# EAGLE schematic esp32 nfc (EAGLE 9.7.0)
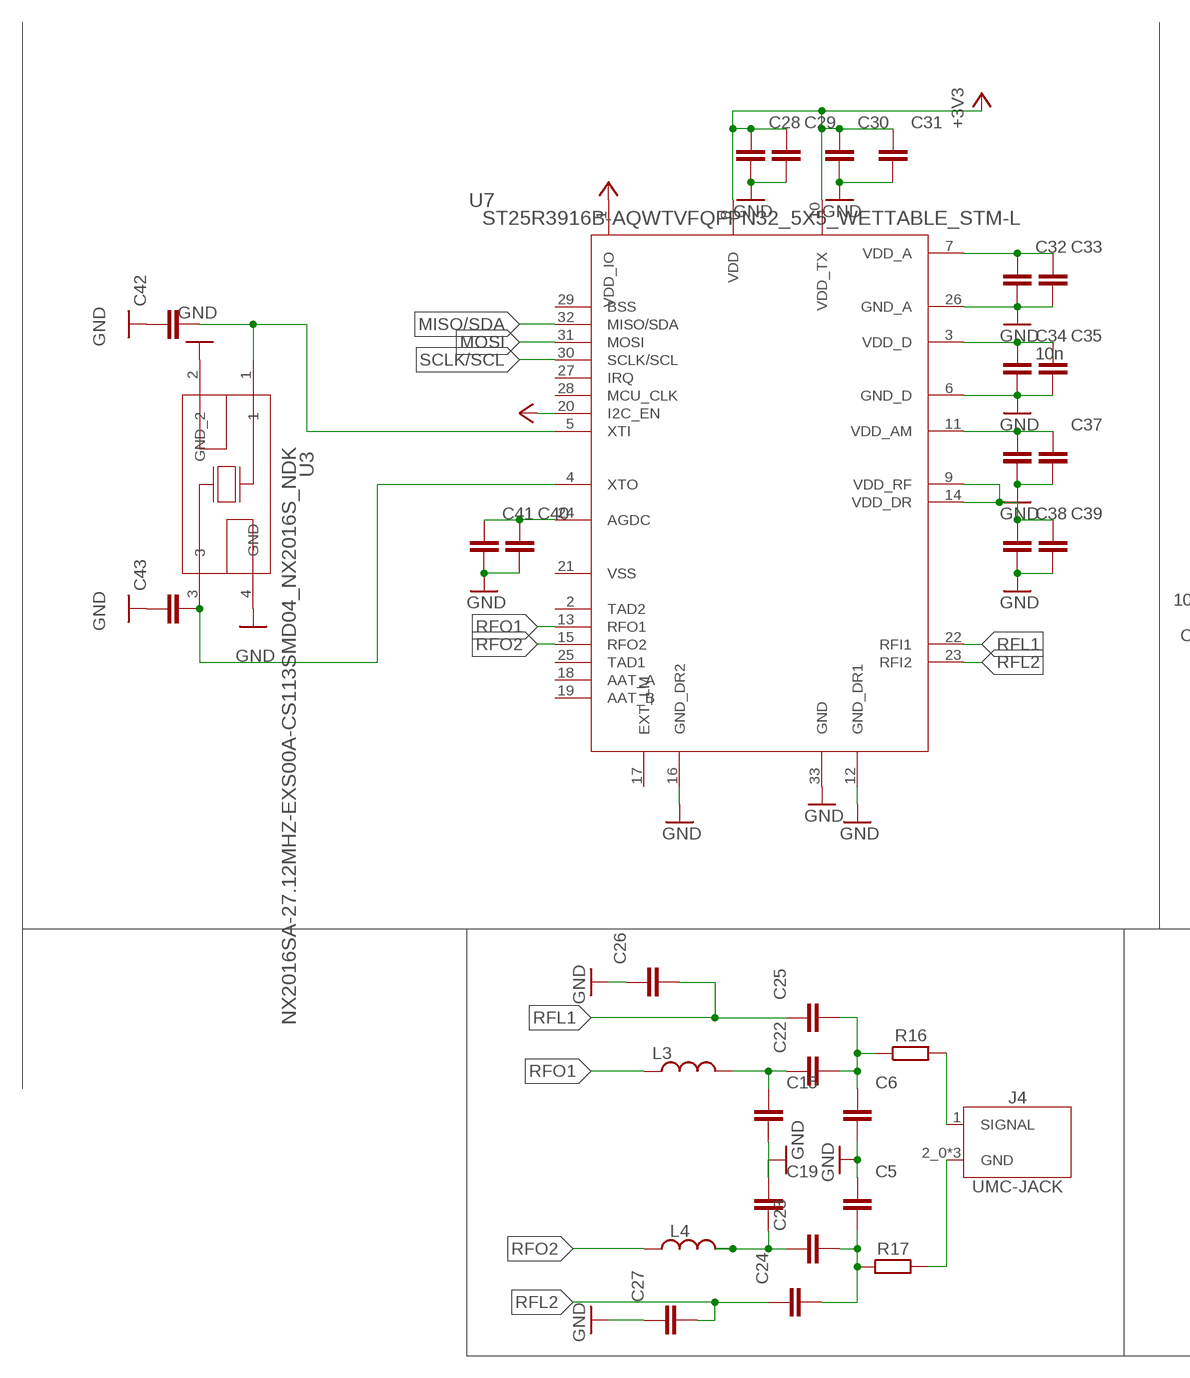
[diagram p0: schematic, sheet 1, part 1 of 2]
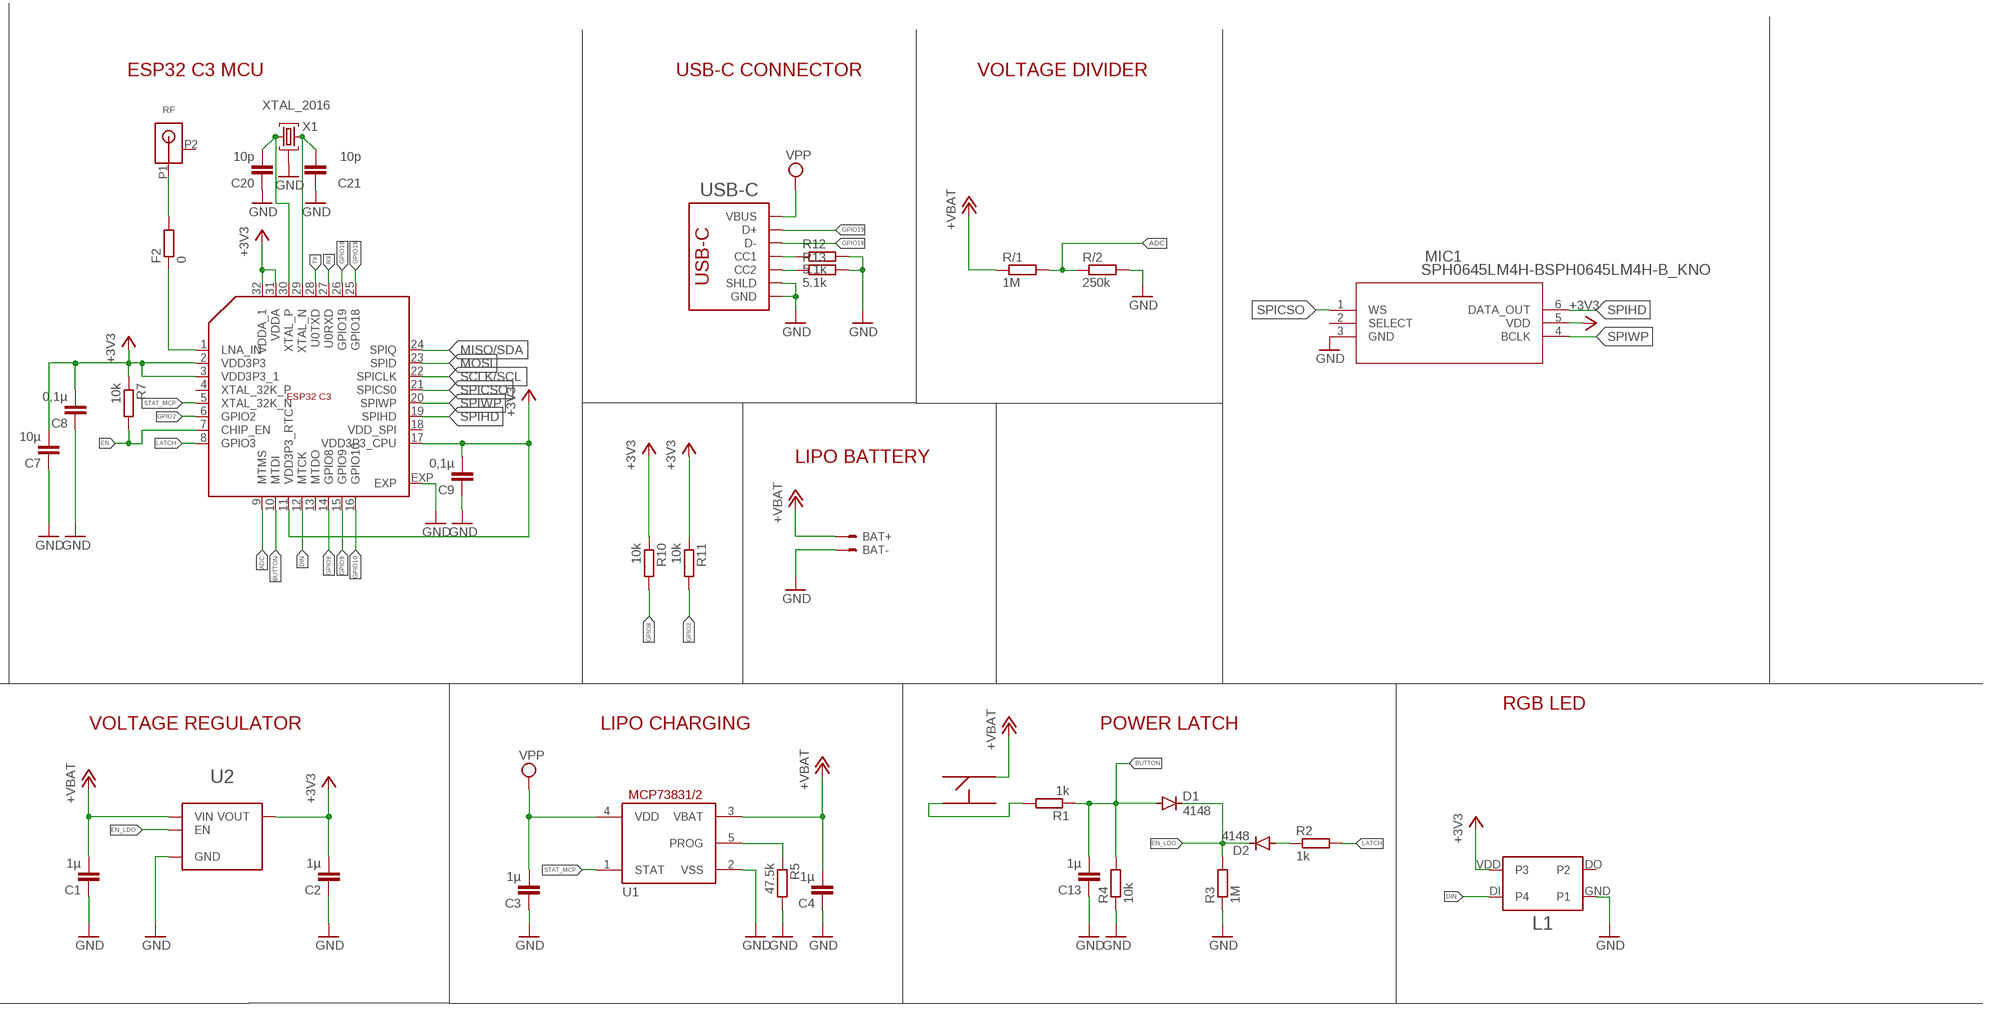
[diagram p1: schematic, sheet 1, part 2 of 2]

## Parts
BAT+  TP/SP-1.5X1.0  [SOLDERPAD_1.5X1.0]
BAT-  TP/SP-1.5X1.0  [SOLDERPAD_1.5X1.0]
C1  1µ  C-EU-0402-WOKEEPOUT_S  [C0402_S]
C2  1µ  C-EU-0402-WOKEEPOUT_S  [C0402_S]
C3  1µ  C-EU-0402-WOKEEPOUT_S  [C0402_S]
C4  1µ  C-EU-0402-WOKEEPOUT_S  [C0402_S]
C5  C_CHIP-0402(1005-METRIC)  [CAPC1005X60]
C6  C_CHIP-0402(1005-METRIC)  [CAPC1005X60]
C7  10µ  C-EU-0402-WOKEEPOUT_S  [C0402_S]
C8  0,1µ  C-EU-0402-WOKEEPOUT_S  [C0402_S]
C9  0,1µ  C-EU-0402-WOKEEPOUT_S  [C0402_S]
C13  1µ  C-EU-0402-WOKEEPOUT_S  [C0402_S]
C15  C_CHIP-0402(1005-METRIC)  [CAPC1005X60]
C19  C_CHIP-0402(1005-METRIC)  [CAPC1005X60]
C20  10p  C-EU-0402-WOKEEPOUT_S  [C0402_S]
C21  10p  C-EU-0402-WOKEEPOUT_S  [C0402_S]
C22  C_CHIP-0402(1005-METRIC)  [CAPC1005X60]
C23  C_CHIP-0402(1005-METRIC)  [CAPC1005X60]
C24  C_CHIP-0402(1005-METRIC)  [CAPC1005X60]
C25  C_CHIP-0402(1005-METRIC)  [CAPC1005X60]
C26  C_CHIP-0402(1005-METRIC)  [CAPC1005X60]
C27  C_CHIP-0402(1005-METRIC)  [CAPC1005X60]
C28  C_CHIP-0402(1005-METRIC)  [CAPC1005X60]
C29  C_CHIP-0402(1005-METRIC)  [CAPC1005X60]
C30  C_CHIP-0402(1005-METRIC)  [CAPC1005X60]
C31  C_CHIP-0402(1005-METRIC)  [CAPC1005X60]
C32  C_CHIP-0402(1005-METRIC)  [CAPC1005X60]
C33  C_CHIP-0402(1005-METRIC)  [CAPC1005X60]
C34  10n  C_CHIP-0402(1005-METRIC)  [CAPC1005X60]
C35  C_CHIP-0402(1005-METRIC)  [CAPC1005X60]
C36  C_CHIP-0402(1005-METRIC)  [CAPC1005X60]
C37  C_CHIP-0402(1005-METRIC)  [CAPC1005X60]
C38  C_CHIP-0402(1005-METRIC)  [CAPC1005X60]
C39  C_CHIP-0402(1005-METRIC)  [CAPC1005X60]
C40  C_CHIP-0402(1005-METRIC)  [CAPC1005X60]
C41  C_CHIP-0402(1005-METRIC)  [CAPC1005X60]
C42  C_CHIP-0402(1005-METRIC)  [CAPC1005X60]
C43  C_CHIP-0402(1005-METRIC)  [CAPC1005X60]
D1  4148  DIODE-SOD523  [SOD523]
D2  4148  DIODE-SOD523  [SOD523]
ESP1  ESP32_C3_QFN32  [QFN32]
F2  0  R-EU-0402-WOKEEPOUT  [R0402]
J4  UMC-JACK  A-1JB  [A-1JB]
L1  WS2812_2020  [WS2812_2020]
L3  L_CHIP-0402(1006-METRIC)  [INDC1006X60N]
L4  L_CHIP-0402(1006-METRIC)  [INDC1006X60N]
MIC1  SPH0645LM4H-BSPH0645LM4H-B_KNO  [SPH0645LM4H-B_KNO]
R1  1k  R-EU-0402-WOKEEPOUT  [R0402]
R2  1k  R-EU-0402-WOKEEPOUT  [R0402]
R3  1M  R-EU-0402-WOKEEPOUT  [R0402]
R4  10k  R-EU-0402-WOKEEPOUT  [R0402]
R5  47.5k  R-EU-0402-WOKEEPOUT  [R0402]
R7  10k  R-EU-0402-WOKEEPOUT  [R0402]
R10  10k  R-EU-0402-WOKEEPOUT  [R0402]
R11  10k  R-EU-0402-WOKEEPOUT  [R0402]
R12  5.1k  R-EU-0402-WOKEEPOUT  [R0402]
R13  5.1k  R-EU-0402-WOKEEPOUT  [R0402]
R16  R_CHIP-0402(1005-METRIC)  [RESC1005X40]
R17  R_CHIP-0402(1005-METRIC)  [RESC1005X40]
R/1  1M  R-EU-0402-WOKEEPOUT  [R0402]
R/2  250k  R-EU-0402-WOKEEPOUT  [R0402]
RF  ANT3216LL00R2400A  [ANT3216LL00R2400A]
U1  BRCL4054BME  MCP73831_SOT23_5  [SOT23-5]
U2  MIC5504  [TDFN4]
U3  NX2016SA-27.12MHZ-EXS00A-CS113SMD04_NX2016S_NDK  [SMD04_NX2016S_NDK]
U7  ST25R3916B-AQWTVFQFPN32_5X5_WETTABLE_STM-L  [VFQFPN32_5X5_WETTABLE_STM-L]
U$1  BUTTON_ST-1187-3  [BUTTON_ST-1187-3]
USB-C  USB_C_C393939  [USBC_C393939]
X1  XTAL_2016  [XTYL_2016]

## Nets
+3V3: C2.P$2 C7.P$2 C8.P$2 C9.P$2 C28.1 C29.1 C30.1 C31.1 ESP1.2(VDD3P3) ESP1.3(VDD3P3_1) ESP1.11(VDD3P3_RTC) ESP1.17(VDD3P3_CPU) ESP1.31(VDDA) ESP1.32(VDDA_1) L1.VDD(P3) MIC1.5(VDD) R7.1 R10.1 R11.1 U2.P1(VOUT) U7.1(VDD_IO) U7.8(VDD) U7.10(VDD_TX) U7.20(I2C_EN)
+VBAT: BAT+.1(S) C1.P$2 C4.P$2 R/1.1 U1.3(VBAT) U2.P4(VIN) U$1.P2
ADC: ESP1.9(MTMS) R/1.2 R/2.1
BUTTON: C13.P$2 D1.A ESP1.10(MTDI) R1.1 R4.2
DIN: ESP1.12(MTCK) L1.DI(P4)
EN: ESP1.7(CHIP_EN) R7.2
EN_LDO: D1.C D2.C R3.2 U2.P3(EN)
GND: BAT-.1(S) C1.P$1 C2.P$1 C3.P$1 C4.P$1 C5.1 C6.2 C7.P$1 C8.P$1 C9.P$1 C13.P$1 C15.2 C19.1 C20.P$1 C21.P$1 C26.1 C27.1 C28.2 C29.2 C30.2 C31.2 C32.2 C33.2 C34.2 C35.2 C36.2 C37.2 C38.2 C39.2 C40.2 C41.2 C42.1 C43.1 ESP1.EXP L1.GND(P1) MIC1.3(GND) R3.1 R4.1 R5.2 R12.2 R13.2 R/2.2 U1.2(VSS) U2.EXP(GND) U2.P2(GND) U3.2(GND_2) U3.4(GND) U7.6(GND_D) U7.12(GND_DR1) U7.16(GND_DR2) U7.26(GND_A) U7.33(GND) USB-C.A1B12(GND) USB-C.B1A12(GND) USB-C.S1(SHLD) USB-C.S2(SHLD) USB-C.S3(SHLD) USB-C.S4(SHLD) X1.P2(G) X1.P4(G)
GPIO2: ESP1.6(GPIO2) R11.2
GPIO8: ESP1.14(GPIO8) R10.2
GPIO9: ESP1.15(GPIO9)
GPIO10: ESP1.16(GPIO10)
GPIO18: ESP1.25(GPIO18) USB-C.A7(D-) USB-C.B7(D-)
GPIO19: ESP1.26(GPIO19) USB-C.A6(D+) USB-C.B6(D+)
LATCH: ESP1.8(GPIO3) R2.2
MISO/SDA: ESP1.22(SPICLK) U7.32(MISO/SDA)
MOSI: ESP1.23(SPID) U7.31(MOSI)
N$1: R1.2 U$1.P3
N$2: C19.2 C23.1 L4.2
N$3: C42.2 U3.1 U7.5(XTI)
N$4: ESP1.1(LNA_IN) F2.1
N$5: C15.1 C22.1 L3.2
N$6: F2.2 RF.P1(ANT)
N$7: C32.1 C33.1 U7.7(VDD_A)
N$8: C5.2 C23.2 C24.2 R17.1
N$9: C6.1 C22.2 C25.2 R16.1
N$16: D2.A R2.1
N$18: R13.1 USB-C.B5(CC2)
N$23: R5.1 U1.5(PROG)
N$25: R12.1 USB-C.A5(CC1)
N$26: C20.P$2 ESP1.30(XTAL_P) X1.P1
N$27: C21.P$2 ESP1.29(XTAL_N) X1.P3
N$29: C34.1 C35.1 U7.3(VDD_D)
N$31: C36.1 C37.1 U7.11(VDD_AM)
N$32: J4.1(SIGNAL) R16.2
N$33: C38.1 C39.1 U7.9(VDD_RF) U7.14(VDD_DR)
N$36: C43.2 U3.3 U7.4(XTO)
N$37: J4.2_0(GND) J4.2_1(GND) J4.2_2(GND) R17.2
N$38: C40.1 C41.1 U7.24(AGDC)
RFL1: C25.1 C26.2 U7.22(RFI1)
RFL2: C24.1 C27.2 U7.23(RFI2)
RFO1: L3.1 U7.13(RFO1)
RFO2: L4.1 U7.15(RFO2)
RX: ESP1.27(U0RXD)
SCLK/SCL: ESP1.24(SPIQ) U7.30(SCLK/SCL)
SPICSO: ESP1.21(SPICS0) MIC1.1(WS)
SPIHD: ESP1.19(SPIHD) MIC1.6(DATA_OUT)
SPIWP: ESP1.20(SPIWP) MIC1.4(BCLK)
STAT_MCP: ESP1.5(XTAL_32K_N) U1.1(STAT)
TX: ESP1.28(U0TXD)
VPP: C3.P$2 U1.4(VDD) USB-C.A4B9(VBUS) USB-C.B4A9(VBUS)
Unconnected: ESP1.4(XTAL_32K_P) ESP1.13(MTDO) ESP1.18(VDD_SPI) L1.DO(P2) MIC1.2(SELECT) RF.P2(GND) U7.2(TAD2) U7.17(EXT_LM) U7.18(AAT_A) U7.19(AAT_B) U7.21(VSS) U7.25(TAD1) U7.27(IRQ) U7.28(MCU_CLK) U7.29(BSS) U$1.P1 U$1.P4

## Notes on the sheet
- ESP32 C3 MCU | USB-C CONNECTOR | VOLTAGE DIVIDER
- LIPO BATTERY
- RGB LED
- VOLTAGE REGULATOR | LIPO CHARGING | POWER LATCH

## Library data of the parts
BAT+ BAT- = iml_elc:TP/SP: Solderpads/Testpads
C1-C4 C7-C9 C13 C20 C21 = moekoe:C-EU-0402-WOKEEPOUT
C5 C6 C15 C19 C22-C43 = Capacitor:C: Capacitor - Generic; CATEGORY: Capacitor
D1 D2 = diode:DIODE-: DIODE
ESP1 = moekoe:ESP32_C3_QFN32
F2 R1-R5 R7 R10-R13 R/1 R/2 = moekoe:R-EU-0402-WOKEEPOUT
J4 = Connector:A-1JB: U.FL (UMCC), AMC Connector Jack, Male Pin 50Ohm Surface Mount Solder Datasheet <https://www.amphenolrf.com/library/download/link/link_id/584922/parent/A-1JB/>; CATEGORY: RF Connectors / Coaxial Connectors; DESCRIPTION: RF Connectors / Coaxial Connectors AMC PCB JACK S/M T&R U.FL Compatible; MANUFACTURER: Amphenol RF; MPN: A-1JB; OPERATING_TEMPERATURE: 40°C TO +90°C; PART_STATUS: Active; PITCH: -; ROHS_COMPLIANCE: RoHS3 Compliant; SERIES: AMC; SUBCATEGORY: RF Connectors / Coaxial Connectors; TYPE: Jack, Male Pin, Surface Mount
L1 = moekoe:WS2812_2020
L3 L4 = Inductor:L: Inductor Fixed - Generic; CATEGORY: Inductor; SUB-CATEGORY: Fixed
MIC1 = 2024-08-21_16-21-19_Library:SPH0645LM4H-B; COPYRIGHT: Copyright (C) 2024 Ultra Librarian. All rights reserved.; MANUFACTURER_PART_NUMBER: SPH0645LM4H-B; MFR_NAME: Knowles
R16 R17 = Resistor:R: Resistor Fixed - Generic; CATEGORY: Resistor; SUB-CATEGORY: Fixed
RF = moekoe:ANT3216LL00R2400A
U1 = moekoe:MCP73831
U2 = moekoe:MIC5504
U3 = 2024-08-20_22-07-07_Library:NX2016SA-27.12MHZ-EXS00A-CS113; COPYRIGHT: Copyright (C) 2024 Ultra Librarian. All rights reserved.; MANUFACTURER_PART_NUMBER: NX2016SA-27.12MHZ-EXS00A-CS11337; MFR_NAME: NDK
U7 = Library:ST25R3916B-AQWT; COPYRIGHT: Copyright (C) 2024 Ultra Librarian. All rights reserved.; MANUFACTURER_PART_NUMBER: ST25R3916B-AQWT; MFR_NAME: STMicroelectronics; TYPE: RFID, RF Access, Monitoring ICs
U$1 = moekoe:BUTTON_ST-1187-3
USB-C = moekoe:USB_C_C393939
X1 = moekoe:XTAL_2016